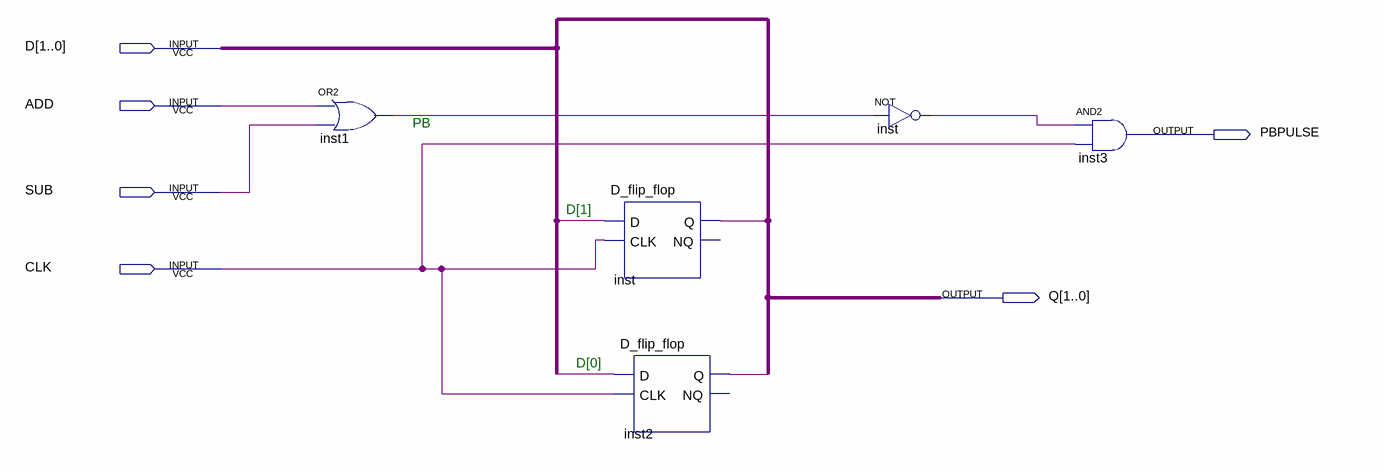
[diagram p0: schematic sheet]
// Quartus schematic modulePulse.bdf as structural Verilog: 5 symbols, 6 pins
module modulePulse (
  input  [1:0] D,
  input  ADD,
  input  SUB,
  input  CLK,
  output PBPULSE,
  output [1:0] Q
);

  wire inst1_out, inst2_q, inst_out, inst_q, undriven, undriven_2;

  or inst1 (inst1_out, ADD, SUB);
  D_flip_flop inst (.D(undriven), .CLK(CLK), .Q(inst_q));  // open: NQ
  D_flip_flop inst2 (.D(undriven_2), .CLK(CLK), .Q(inst2_q));  // open: NQ
  not inst_dup2 (inst_out, inst1_out);
  and inst3 (PBPULSE, inst_out, CLK);

  assign Q = D;

  // Notes on the sheet:
  //   PB
  //   D[1]
  //   D[0]
endmodule
